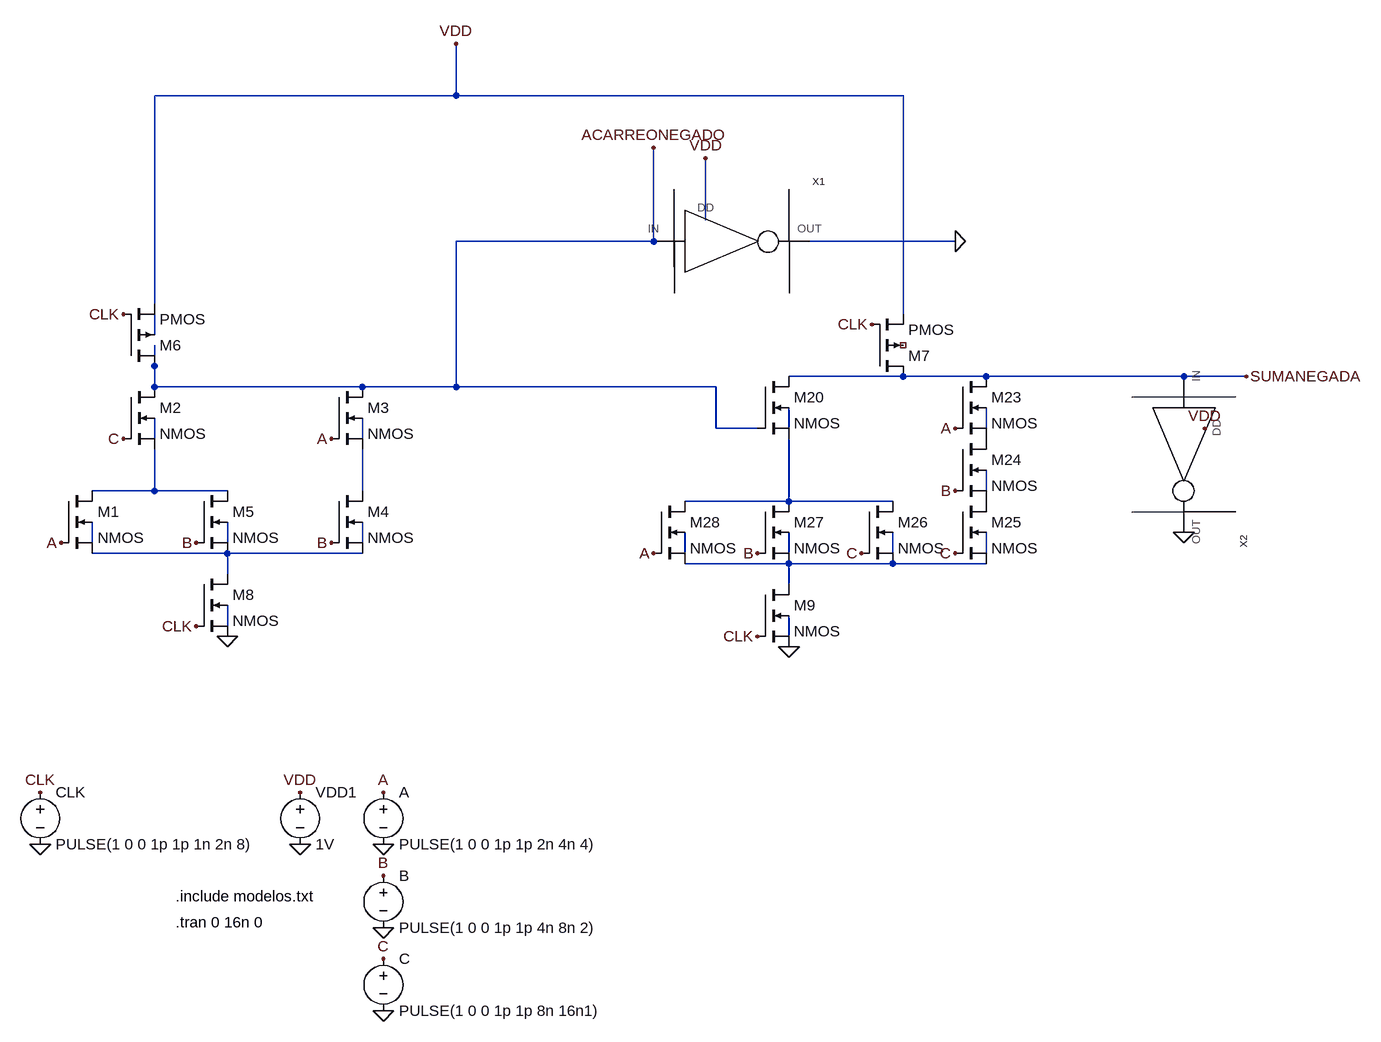
[diagram p0: schematic 3.2.asc]
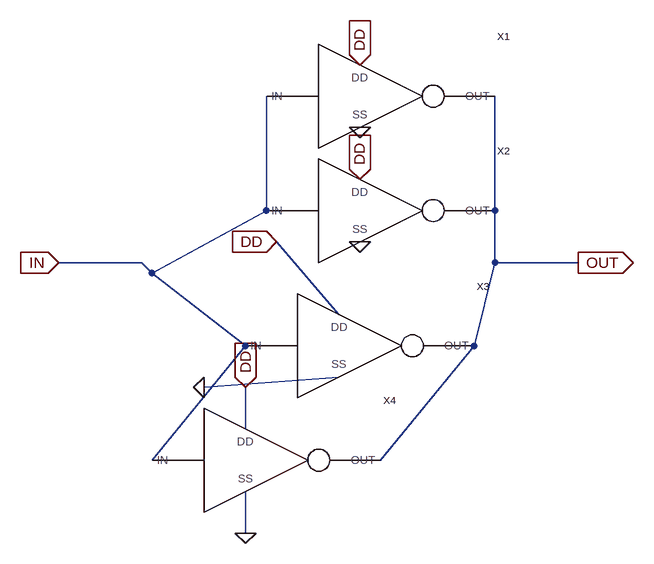
[diagram p1: sub-circuit udcarga.asc]
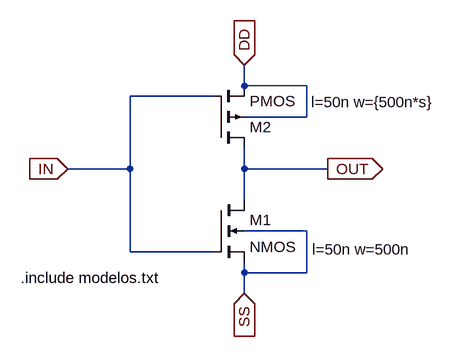
[diagram p2: sub-circuit inversorp.asc]
3.2.asc, the LTspice schematic file:
Version 4
SHEET 1 1656 680
WIRE 240 -1056 240 -1136
WIRE 240 -1056 -224 -1056
WIRE 928 -1056 240 -1056
WIRE 928 -720 928 -1056
WIRE 624 -864 624 -960
WIRE 544 -832 544 -976
WIRE 544 -832 240 -832
WIRE 1008 -832 784 -832
WIRE -224 -736 -224 -1056
WIRE -224 -688 -224 -720
WIRE -224 -640 -224 -672
WIRE 928 -624 752 -624
WIRE 1056 -624 928 -624
WIRE 1360 -624 1056 -624
WIRE 1456 -624 1360 -624
WIRE -224 -608 -224 -640
WIRE 96 -608 -224 -608
WIRE 240 -608 240 -832
WIRE 240 -608 96 -608
WIRE 640 -608 240 -608
WIRE 640 -544 640 -608
WIRE 704 -544 640 -544
WIRE 752 -544 752 -576
WIRE 1056 -544 1056 -576
WIRE -224 -528 -224 -560
WIRE 96 -528 96 -560
WIRE -224 -448 -224 -512
WIRE -224 -448 -320 -448
WIRE -112 -448 -224 -448
WIRE 96 -448 96 -512
WIRE 1056 -448 1056 -480
WIRE 752 -432 752 -528
WIRE 752 -432 592 -432
WIRE 912 -432 752 -432
WIRE -320 -368 -320 -400
WIRE -112 -368 -112 -400
WIRE 96 -368 96 -400
WIRE -112 -352 -320 -352
WIRE 96 -352 -112 -352
WIRE 592 -352 592 -384
WIRE 752 -352 752 -384
WIRE 912 -352 912 -384
WIRE 1056 -352 1056 -384
WIRE 752 -336 592 -336
WIRE 912 -336 752 -336
WIRE 1056 -336 912 -336
WIRE -112 -320 -112 -352
WIRE 752 -304 752 -336
WIRE -112 -240 -112 -272
WIRE 752 -224 752 -256
FLAG 0 96 0
FLAG 128 96 0
FLAG 128 224 0
FLAG 0 16 VDD
FLAG 128 16 A
FLAG 128 144 B
FLAG 128 352 0
FLAG 128 272 C
FLAG -368 -368 A
FLAG -160 -368 B
FLAG 48 -368 B
FLAG 48 -528 A
FLAG -272 -528 C
FLAG 240 -1136 VDD
FLAG 544 -352 A
FLAG 1008 -544 A
FLAG 704 -352 B
FLAG 1008 -448 B
FLAG 864 -352 C
FLAG 1008 -352 C
FLAG 1456 -624 SUMANEGADA
FLAG 544 -976 ACARREONEGADO
FLAG -112 -224 0
FLAG 752 -208 0
FLAG -272 -720 CLK
FLAG 880 -704 CLK
FLAG 704 -224 CLK
FLAG -160 -240 CLK
FLAG -400 96 0
FLAG -400 16 CLK
FLAG 1008 -832 0
FLAG 1360 -384 0
FLAG 1392 -544 VDD
FLAG 624 -960 VDD
SYMBOL voltage 0 0 R0
WINDOW 123 0 0 Left 0
WINDOW 39 0 0 Left 0
SYMATTR InstName VDD1
SYMATTR Value 1V
SYMBOL voltage 128 0 R0
WINDOW 123 0 0 Left 0
WINDOW 39 0 0 Left 0
SYMATTR InstName A
SYMATTR Value PULSE(1 0 0 1p 1p 2n 4n 4)
SYMBOL voltage 128 128 R0
WINDOW 123 0 0 Left 0
WINDOW 39 0 0 Left 0
SYMATTR InstName B
SYMATTR Value PULSE(1 0 0 1p 1p 4n 8n 2)
SYMBOL voltage 128 256 R0
WINDOW 123 0 0 Left 0
WINDOW 39 0 0 Left 0
SYMATTR InstName C
SYMATTR Value PULSE(1 0 0 1p 1p 8n 16n1)
SYMBOL nmos4 -368 -448 R0
SYMATTR InstName M1
SYMATTR Value2 l=50n w=1500n
SYMBOL nmos4 -272 -608 R0
SYMATTR InstName M2
SYMATTR Value2 l=50n w=1500n
SYMBOL nmos4 48 -608 R0
SYMATTR InstName M3
SYMATTR Value2 l=50n w=1500n
SYMBOL nmos4 48 -448 R0
SYMATTR InstName M4
SYMATTR Value2 l=50n w=1500n
SYMBOL nmos4 -160 -448 R0
SYMATTR InstName M5
SYMATTR Value2 l=50n w=1500n
SYMBOL nmos4 704 -624 R0
SYMATTR InstName M20
SYMATTR Value2 l=50n w=1500n
SYMBOL nmos4 1008 -624 R0
SYMATTR InstName M23
SYMATTR Value2 l=50n w=2000n
SYMBOL nmos4 1008 -528 R0
SYMATTR InstName M24
SYMATTR Value2 l=50n w=2000n
SYMBOL nmos4 1008 -432 R0
SYMATTR InstName M25
SYMATTR Value2 l=50n w=2000n
SYMBOL nmos4 864 -432 R0
SYMATTR InstName M26
SYMATTR Value2 l=50n w=1500n
SYMBOL nmos4 704 -432 R0
SYMATTR InstName M27
SYMATTR Value2 l=50n w=1500n
SYMBOL nmos4 544 -432 R0
SYMATTR InstName M28
SYMATTR Value2 l=50n w=1500n
SYMBOL pmos4 -272 -640 M180
SYMATTR InstName M6
SYMATTR Value2 l=50n w=1000n
SYMBOL pmos4 880 -624 M180
SYMATTR InstName M7
SYMATTR Value2 l=50n w=1000n
SYMBOL nmos4 -160 -320 R0
SYMATTR InstName M8
SYMATTR Value2 l=50n w=1500n
SYMBOL nmos4 704 -304 R0
SYMATTR InstName M9
SYMATTR Value2 l=50n w=2000n
SYMBOL voltage -400 0 R0
WINDOW 123 0 0 Left 0
WINDOW 39 0 0 Left 0
SYMATTR InstName CLK
SYMATTR Value PULSE(1 0 0 1p 1p 1n 2n 8)
SYMBOL udcarga 624 -832 R0
SYMATTR InstName X1
SYMBOL udcarga 1360 -544 R90
SYMATTR InstName X2
TEXT -192 176 Left 2 !.include modelos.txt
TEXT -192 216 Left 2 !.tran 0 16n 0

udcarga.asc, the sub-circuit schematic file:
Version 4
SHEET 1 880 820
WIRE -16 304 -16 128
WIRE 336 304 336 128
WIRE -208 384 -336 384
WIRE 336 384 336 304
WIRE 464 384 336 384
WIRE -192 400 -16 304
WIRE -192 400 -208 384
WIRE 96 464 0 352
WIRE -48 512 -192 400
WIRE 304 512 336 384
WIRE -112 576 96 560
WIRE -48 640 -48 576
WIRE -192 688 -48 512
WIRE 160 688 304 512
WIRE -48 800 -48 736
FLAG 464 384 OUT
IOPIN 464 384 Out
FLAG -336 384 IN
IOPIN -336 384 In
FLAG 128 80 DD
IOPIN 128 80 In
FLAG 128 256 DD
IOPIN 128 256 In
FLAG 0 352 DD
IOPIN 0 352 In
FLAG -48 576 DD
IOPIN -48 576 In
FLAG 128 176 0
FLAG 128 352 0
FLAG -112 576 0
FLAG -48 800 0
SYMBOL inversorp 64 128 R0
SYMATTR InstName X1
SYMBOL inversorp 64 304 R0
SYMATTR InstName X2
SYMBOL inversorp 32 512 R0
SYMATTR InstName X3
SYMBOL inversorp -112 688 R0
SYMATTR InstName X4

inversorp.asc, the sub-circuit schematic file:
Version 4
SHEET 1 1048 680
WIRE 112 32 112 0
WIRE 208 32 112 32
WIRE 64 48 -64 48
WIRE 208 80 208 32
WIRE 208 80 112 80
WIRE -64 160 -64 48
WIRE -64 160 -160 160
WIRE 112 160 112 128
WIRE 240 160 112 160
WIRE 112 208 112 160
WIRE 208 256 112 256
WIRE -64 288 -64 160
WIRE 64 288 -64 288
WIRE 112 320 112 304
WIRE 208 320 208 256
WIRE 208 320 112 320
WIRE 112 352 112 320
FLAG 112 0 DD
IOPIN 112 0 In
FLAG -160 160 IN
IOPIN -160 160 In
FLAG 240 160 OUT
IOPIN 240 160 Out
FLAG 112 352 SS
IOPIN 112 352 In
SYMBOL nmos4 64 208 R0
WINDOW 123 152 76 Left 2
WINDOW 0 56 31 Left 2
SYMATTR Value2 l=50n w=500n
SYMATTR InstName M1
SYMBOL pmos4 64 128 M180
WINDOW 123 151 71 Left 2
SYMATTR Value2 l=50n w={500n*s}
SYMATTR InstName M2
TEXT -232 328 Left 2 !.include modelos.txt

The netlist it stands for:
* 3.2.asc
VDD1 VDD 0 1V
V§A A 0 PULSE(1 0 0 1p 1p 2n 4n 4)
V§B B 0 PULSE(1 0 0 1p 1p 4n 8n 2)
V§C C 0 PULSE(1 0 0 1p 1p 8n 16n1)
M1 N006 A N013 N010 NMOS l=50n w=1500n
M2 ACARREONEGADO C N006 N004 NMOS l=50n w=1500n
M3 ACARREONEGADO A N007 N005 NMOS l=50n w=1500n
M4 N007 B N013 N012 NMOS l=50n w=1500n
M5 N006 B N013 N011 NMOS l=50n w=1500n
M20 SUMANEGADA ACARREONEGADO N009 N002 NMOS l=50n w=1500n
M23 SUMANEGADA A P001 N003 NMOS l=50n w=2000n
M24 P001 B P002 N008 NMOS l=50n w=2000n
M25 P002 C N018 N017 NMOS l=50n w=2000n
M26 N009 C N018 N016 NMOS l=50n w=1500n
M27 N009 B N018 N015 NMOS l=50n w=1500n
M28 N009 A N018 N014 NMOS l=50n w=1500n
M6 ACARREONEGADO CLK VDD N001 PMOS l=50n w=1000n
M7 SUMANEGADA CLK VDD NC_01 PMOS l=50n w=1000n
M8 N013 CLK 0 N019 NMOS l=50n w=1500n
M9 N018 CLK 0 N020 NMOS l=50n w=2000n
V§CLK CLK 0 PULSE(1 0 0 1p 1p 1n 2n 8)
XX1 0 ACARREONEGADO VDD udcarga
XX2 0 SUMANEGADA VDD udcarga

* block symbol definitions
.subckt udcarga OUT IN DD
XX1 DD 0 IN OUT inversorp params: s=2
XX2 DD 0 IN OUT inversorp params: s=2
XX3 DD 0 IN OUT inversorp params: s=2
XX4 DD 0 IN OUT inversorp params: s=2
.ends udcarga

.subckt inversorp DD SS IN OUT
M1 OUT IN SS SS NMOS l=50n w=500n
M2 OUT IN DD DD PMOS l=50n w={500n*s}
.include modelos.txt
.ends inversorp

.model NMOS NMOS
.model PMOS PMOS
.lib standard.mos
.include modelos.txt
.tran 0 16n 0
.backanno
.end